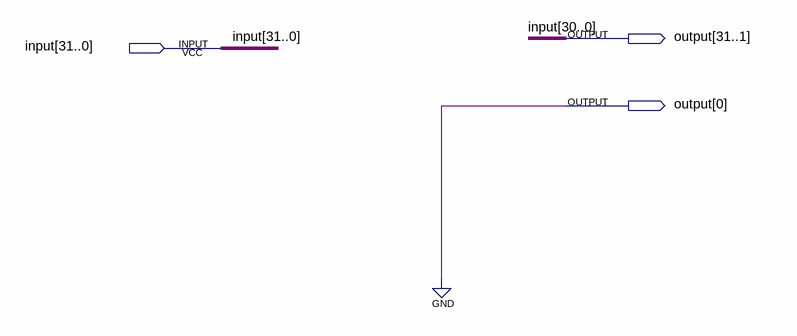
[diagram p0: schematic sheet]
// Quartus schematic SHL.bdf as structural Verilog: 0 symbols, 3 pins
module SHL (
  input  [31:0] \input ,
  output [31:0] \output 
);


  assign \output  = {\input [30:0], 1'b0};
endmodule
